# Altium schematic sheet stlink.SchDoc
size Letter; SheetNumber: 11; SheetTotal: 15
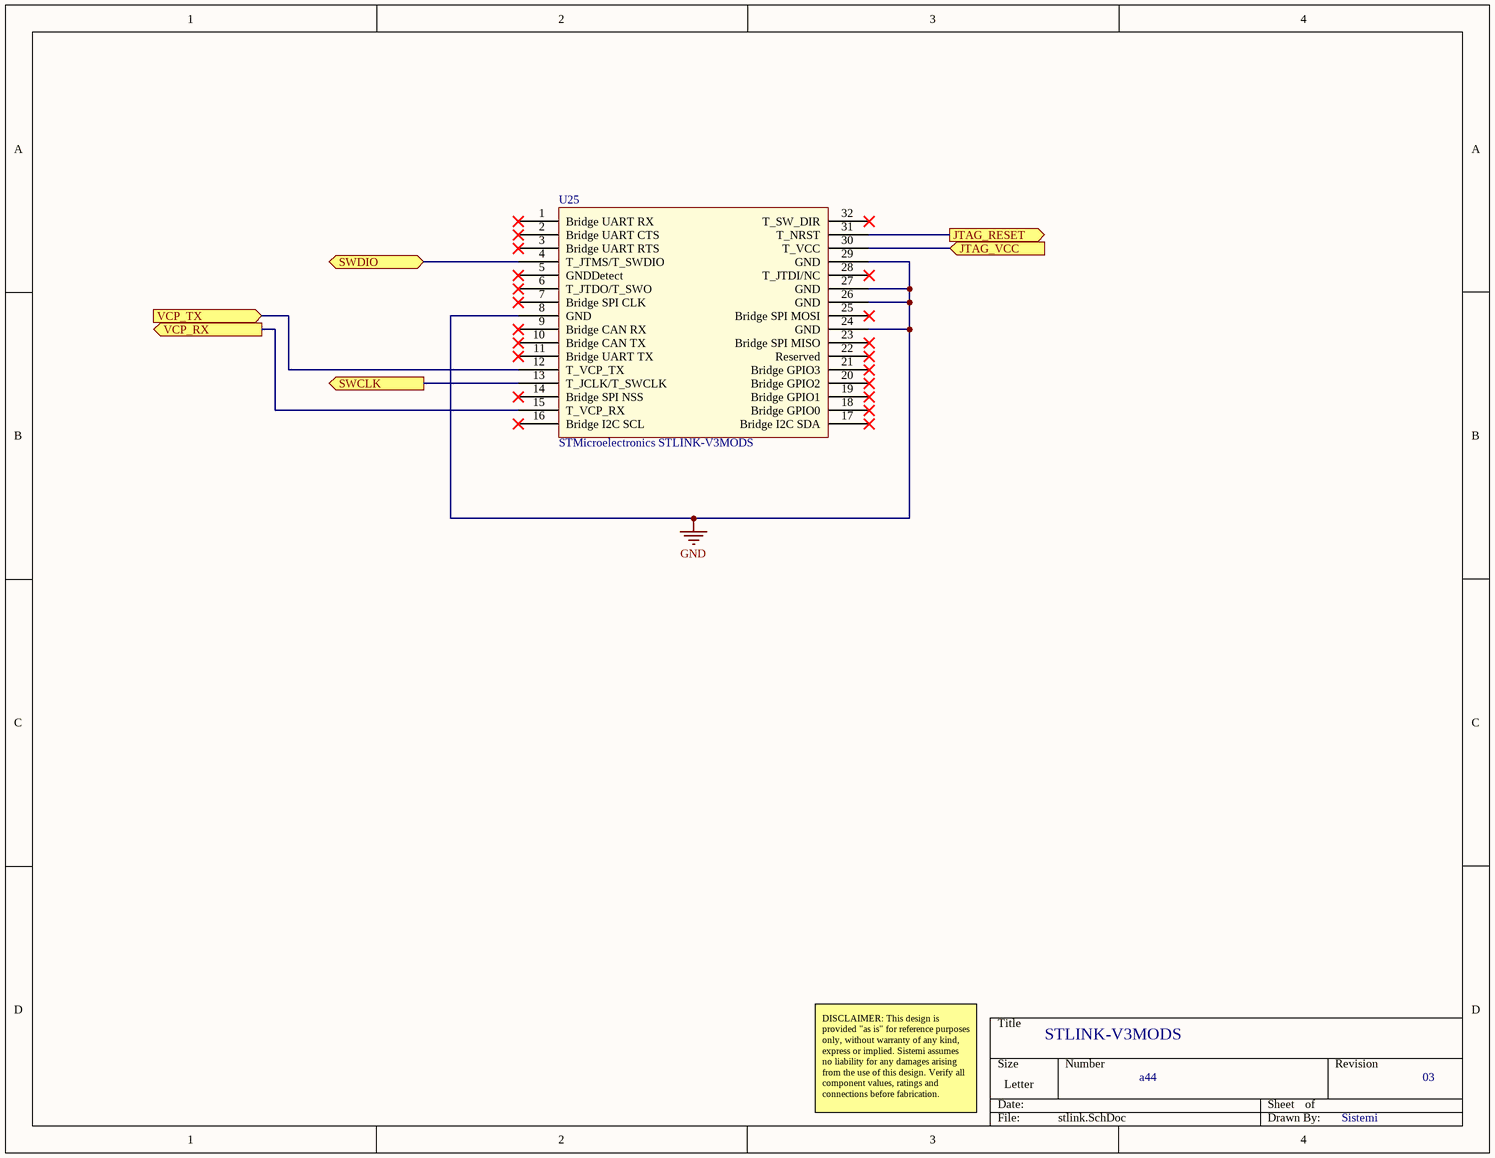
[diagram p0: stlink.SchDoc]

## Parts
U25  STMicroelectronics STLINK-V3MODS  [STMicroelectronics STLINK-V3MODS-Footprint-1]

## Ports
JTAG_RESET (out), JTAG_VCC (in), SWCLK (out), SWDIO (bidir), VCP_RX (out), VCP_TX (in)

## Nets
GND: U25.8(GND) U25.24(GND) U25.26(GND) U25.27(GND) U25.29(GND)
JTAG_RESET: U25.31(T_NRST) ; port JTAG_RESET
JTAG_VCC: U25.30(T_VCC) ; port JTAG_VCC
SWCLK: U25.13(T_JCLK/T_SWCLK) ; port SWCLK
SWDIO: U25.4(T_JTMS/T_SWDIO) ; port SWDIO
VCP_RX: U25.15(T_VCP_RX) ; port VCP_RX
VCP_TX: U25.12(T_VCP_TX) ; port VCP_TX

Not connected (* = marked no-connect by the designer): U25 1(Bridge_UART_RX)* 2(Bridge_UART_CTS)* 3(Bridge_UART_RTS)* 5(GNDDetect)* 6(T_JTDO/T_SWO)* 7(Bridge_SPI_CLK)* 9(Bridge_CAN_RX)* 10(Bridge_CAN_TX)* 11(Bridge_UART_TX)* 14(Bridge_SPI_NSS)* 16(Bridge_I2C_SCL)* 17(Bridge_I2C_SDA)* 18(Bridge_GPIO0)* 19(Bridge_GPIO1)* 20(Bridge_GPIO2)* 21(Bridge_GPIO3)* 22(Reserved)* 23(Bridge_SPI_MISO)* 25(Bridge_SPI_MOSI)* 28(T_JTDI/NC)* 32(T_SW_DIR)*

## Notes on the sheet
- STLINK-V3MODS
- DISCLAIMER: This design is provided "as is" for reference purposes only, without warranty of any kind, express or implied. Sistemi assumes no liability for any damages arising from the use of this design. Verify all component values, ratings and connections before fabrication.
- a44
- 03
- Sistemi

## Library data of the parts
U25 = CMP-cbab04c6b8a5146c-3: STLINK-V3 Modular In-Circuit Debugger and Programmer for STM32 Microcontrollers; Octopart Url: https://octopart.com/stlink-v3mods-stmicroelectronics-107435624; Manufacturer Part Number: STLINK-V3MODS; Lifecycle Status: Not Listed by Manufacturer; OctopartID: cbab04c6b8a5146c